# Altium schematic sheet Sheet3.SchDoc
size A4; SheetNumber: 3; SheetTotal: 3
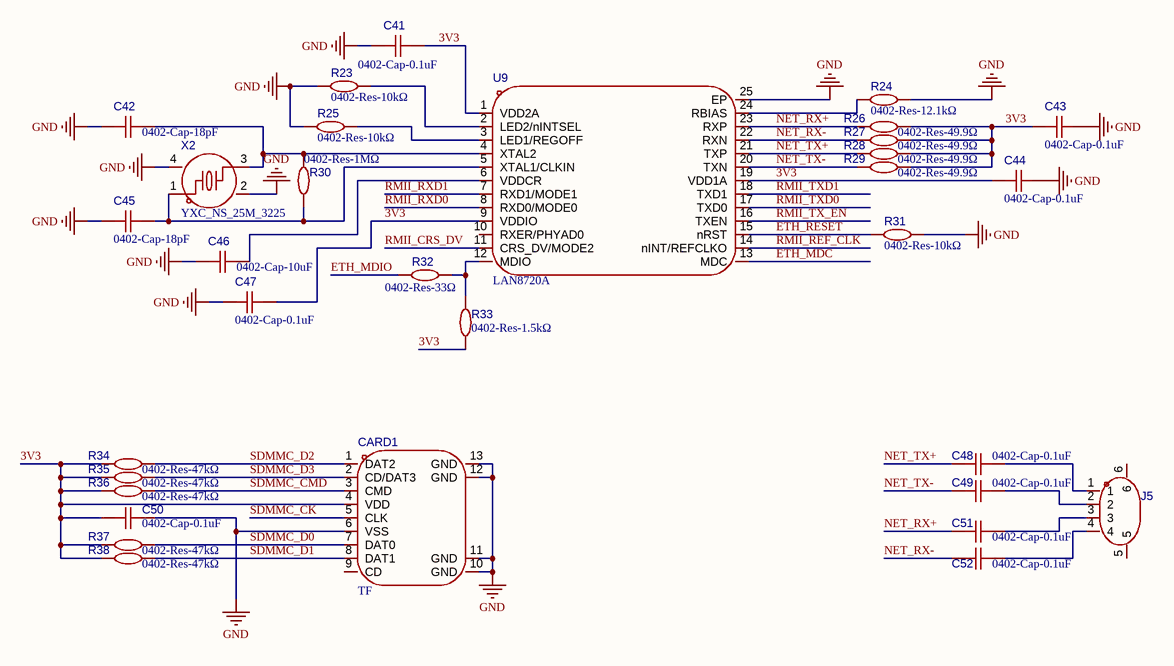
[diagram p0: Sheet3.SchDoc]

## Parts
C41  0402-Cap-0.1uF  [0402-Cap]
C42  0402-Cap-18pF  [0402-Cap]
C43  0402-Cap-0.1uF  [0402-Cap]
C44  0402-Cap-0.1uF  [0402-Cap]
C45  0402-Cap-18pF  [0402-Cap]
C46  0402-Cap-10uF  [0402-Cap]
C47  0402-Cap-0.1uF  [0402-Cap]
C48  0402-Cap-0.1uF  [0402-Cap]
C49  0402-Cap-0.1uF  [0402-Cap]
C50  0402-Cap-0.1uF  [0402-Cap]
C51  0402-Cap-0.1uF  [0402-Cap]
C52  0402-Cap-0.1uF  [0402-Cap]
CARD1  TF  [TF]
J5  PM1.00-1-4PY  [PM1.00-1-4PY]  (value not drawn)
R23  0402-Res-10kΩ  [0402-Res]
R24  0402-Res-12.1kΩ  [0402-Res]
R25  0402-Res-10kΩ  [0402-Res]
R26  0402-Res-49.9Ω  [0402-Res]
R27  0402-Res-49.9Ω  [0402-Res]
R28  0402-Res-49.9Ω  [0402-Res]
R29  0402-Res-49.9Ω  [0402-Res]
R30  0402-Res-1MΩ  [0402-Res]
R31  0402-Res-10kΩ  [0402-Res]
R32  0402-Res-33Ω  [0402-Res]
R33  0402-Res-1.5kΩ  [0402-Res]
R34  0402-Res-47kΩ  [0402-Res]
R35  0402-Res-47kΩ  [0402-Res]
R36  0402-Res-47kΩ  [0402-Res]
R37  0402-Res-47kΩ  [0402-Res]
R38  0402-Res-47kΩ  [0402-Res]
U9  LAN8720A  [LAN8720A]
X2  YXC_NS_25M_3225  [YXC_NS_25M_3225]

## Nets
GND: C41.2 C42.2 C43.2 C44.1 C45.1 C46.2 C47.2 C50.1 CARD1.6(VSS) CARD1.10(GND) CARD1.11(GND) CARD1.12(GND) CARD1.13(GND) R23.2 R24.1 R25.2 R31.1 U9.25(EP) X2.2(GND) X2.4(GND)
3V3: C41.1 C43.1 C44.2 C47.1 C50.2 CARD1.4(VDD) R26.1 R27.1 R28.1 R29.1 R33.2 R34.2 R35.2 R36.2 R37.2 R38.2 U9.1(VDD2A) U9.9(VDDIO) U9.19(VDD1A)
ETH_MDC: U9.13(MDC)
ETH_MDIO: R32.2
ETH_RESET: R31.2 U9.15(nRST)
NET_RX+: C51.2 R26.2 U9.23(RXP)
NET_RX-: C52.2 R27.2 U9.22(RXN)
NET_TX+: C48.2 R28.2 U9.21(TXP)
NET_TX-: C49.2 R29.2 U9.20(TXN)
RMII_CRS_DV: U9.11(CRS_DV/MODE2)
RMII_REF_CLK: U9.14(nINT/REFCLKO)
RMII_RXD0: U9.8(RXD0/MODE0)
RMII_RXD1: U9.7(RXD1/MODE1)
RMII_TX_EN: U9.16(TXEN)
RMII_TXD0: U9.17(TXD0)
RMII_TXD1: U9.18(TXD1)
SDMMC_CK: CARD1.5(CLK)
SDMMC_CMD: CARD1.3(CMD) R36.1
SDMMC_D0: CARD1.7(DAT0) R37.1
SDMMC_D1: CARD1.8(DAT1) R38.1
SDMMC_D2: CARD1.1(DAT2) R34.1
SDMMC_D3: CARD1.2(CD/DAT3) R35.1
NetC42_1: C42.1 R30.2 U9.4(XTAL2) X2.3
NetC45_2: C45.2 R30.1 U9.5(XTAL1/CLKIN) X2.1
NetC46_1: C46.1 U9.6(VDDCR)
NetC48_1: C48.1 J5.1
NetC49_1: C49.1 J5.2
NetC51_1: C51.1 J5.3
NetC52_1: C52.1 J5.4
NetR23_1: R23.1 U9.2(LED2/nINTSEL)
NetR24_2: R24.2 U9.24(RBIAS)
NetR25_1: R25.1 U9.3(LED1/REGOFF)
NetR32_1: R32.1 R33.1 U9.12(MDIO)

Not connected (* = marked no-connect by the designer): CARD1 9(CD); J5 5 6; U9 10(RXER/PHYAD0)

## Library data of the parts
C41-C52 = 0402-Cap: Symbol: CGA0402X5R106M6R3GT
CARD1 = TF: TF-01A_C2889258; Symbol: TF-01A_C2889258
J5 = PM1.00-1-4PY: 插针结构:1x4P;间距:1mm;安装方式:卧贴;参考系列:SH;总PIN数:4P;排数:1;每排PIN数:4;行距:-;额定电流:1A;触头材质:黄铜;触头镀层:锡;工作温度:-40℃~+85℃;; Manufacturer: Megastar(兆星); Symbol: ZX-SH1.0-4PWT; AddInBom: yes; ModelId: 12775bf286e24184ade05a2f5a42ab9d; ModelName: CONN-SMD_4P-P1.00_MEGASTAR_ZX-SH1.0-4PWT; ModelTransform: 250.393,198.8185,0,0,0,0,0.2,-7.877,0; Pins Structure: 1x4P; Pitch: 1mm; Reference Series: SH; Number of PINs Per Row: 4; Current Rating: 1A; Voltage Rating: 50V; Plastic Material: LCP; Supplementary Features: 辅助焊脚; Z-Height of the Board: 3.15mm; X-Length of Bottom Edge on Board (Spacing Line): 6.35mm; Y-Width of Bottom Edge on Board: 4.3mm; LCSC Part Name: 1x4P 间距:1mm 卧贴 系列:SH; SupplierPart: C7430446; ManufacturerPart: ZX-SH1.0-4PWT; Supplier Footprint: SMD,P=1mm,卧贴; JLCPCB Part Class: Extended Part; Datasheet: https://item.szlcsc.com/datasheet/ZX-SH1.0-4PWT/8430315.html; Supplier: LCSC; ConvertToPcb: yes; FootprintName: CONN-SMD_4P-P1.00_MEGASTAR_ZX-SH1.0-4PWT; Mounting Type: 卧贴; Number of Pins: 4P; Number of Rows: 1; Row Spacing: -; Contact Material: 黄铜; Contact Plating: 锡; Operating Temperature: -40℃~+85℃; Flame Retardant Rating: -; Color: 米色
R23-R38 = 0402-Res: Symbol: 0402WGF1002TCE
U9 = LAN8720A: Symbol: LAN8720A-CP-TR
X2 = YXC_NS_25M_3225: XL2EL89CSI-111YLC-25M; Symbol: XL2EL89CSI-111YLC-25M